# Altium project ESP32_HMI.PrjPcb
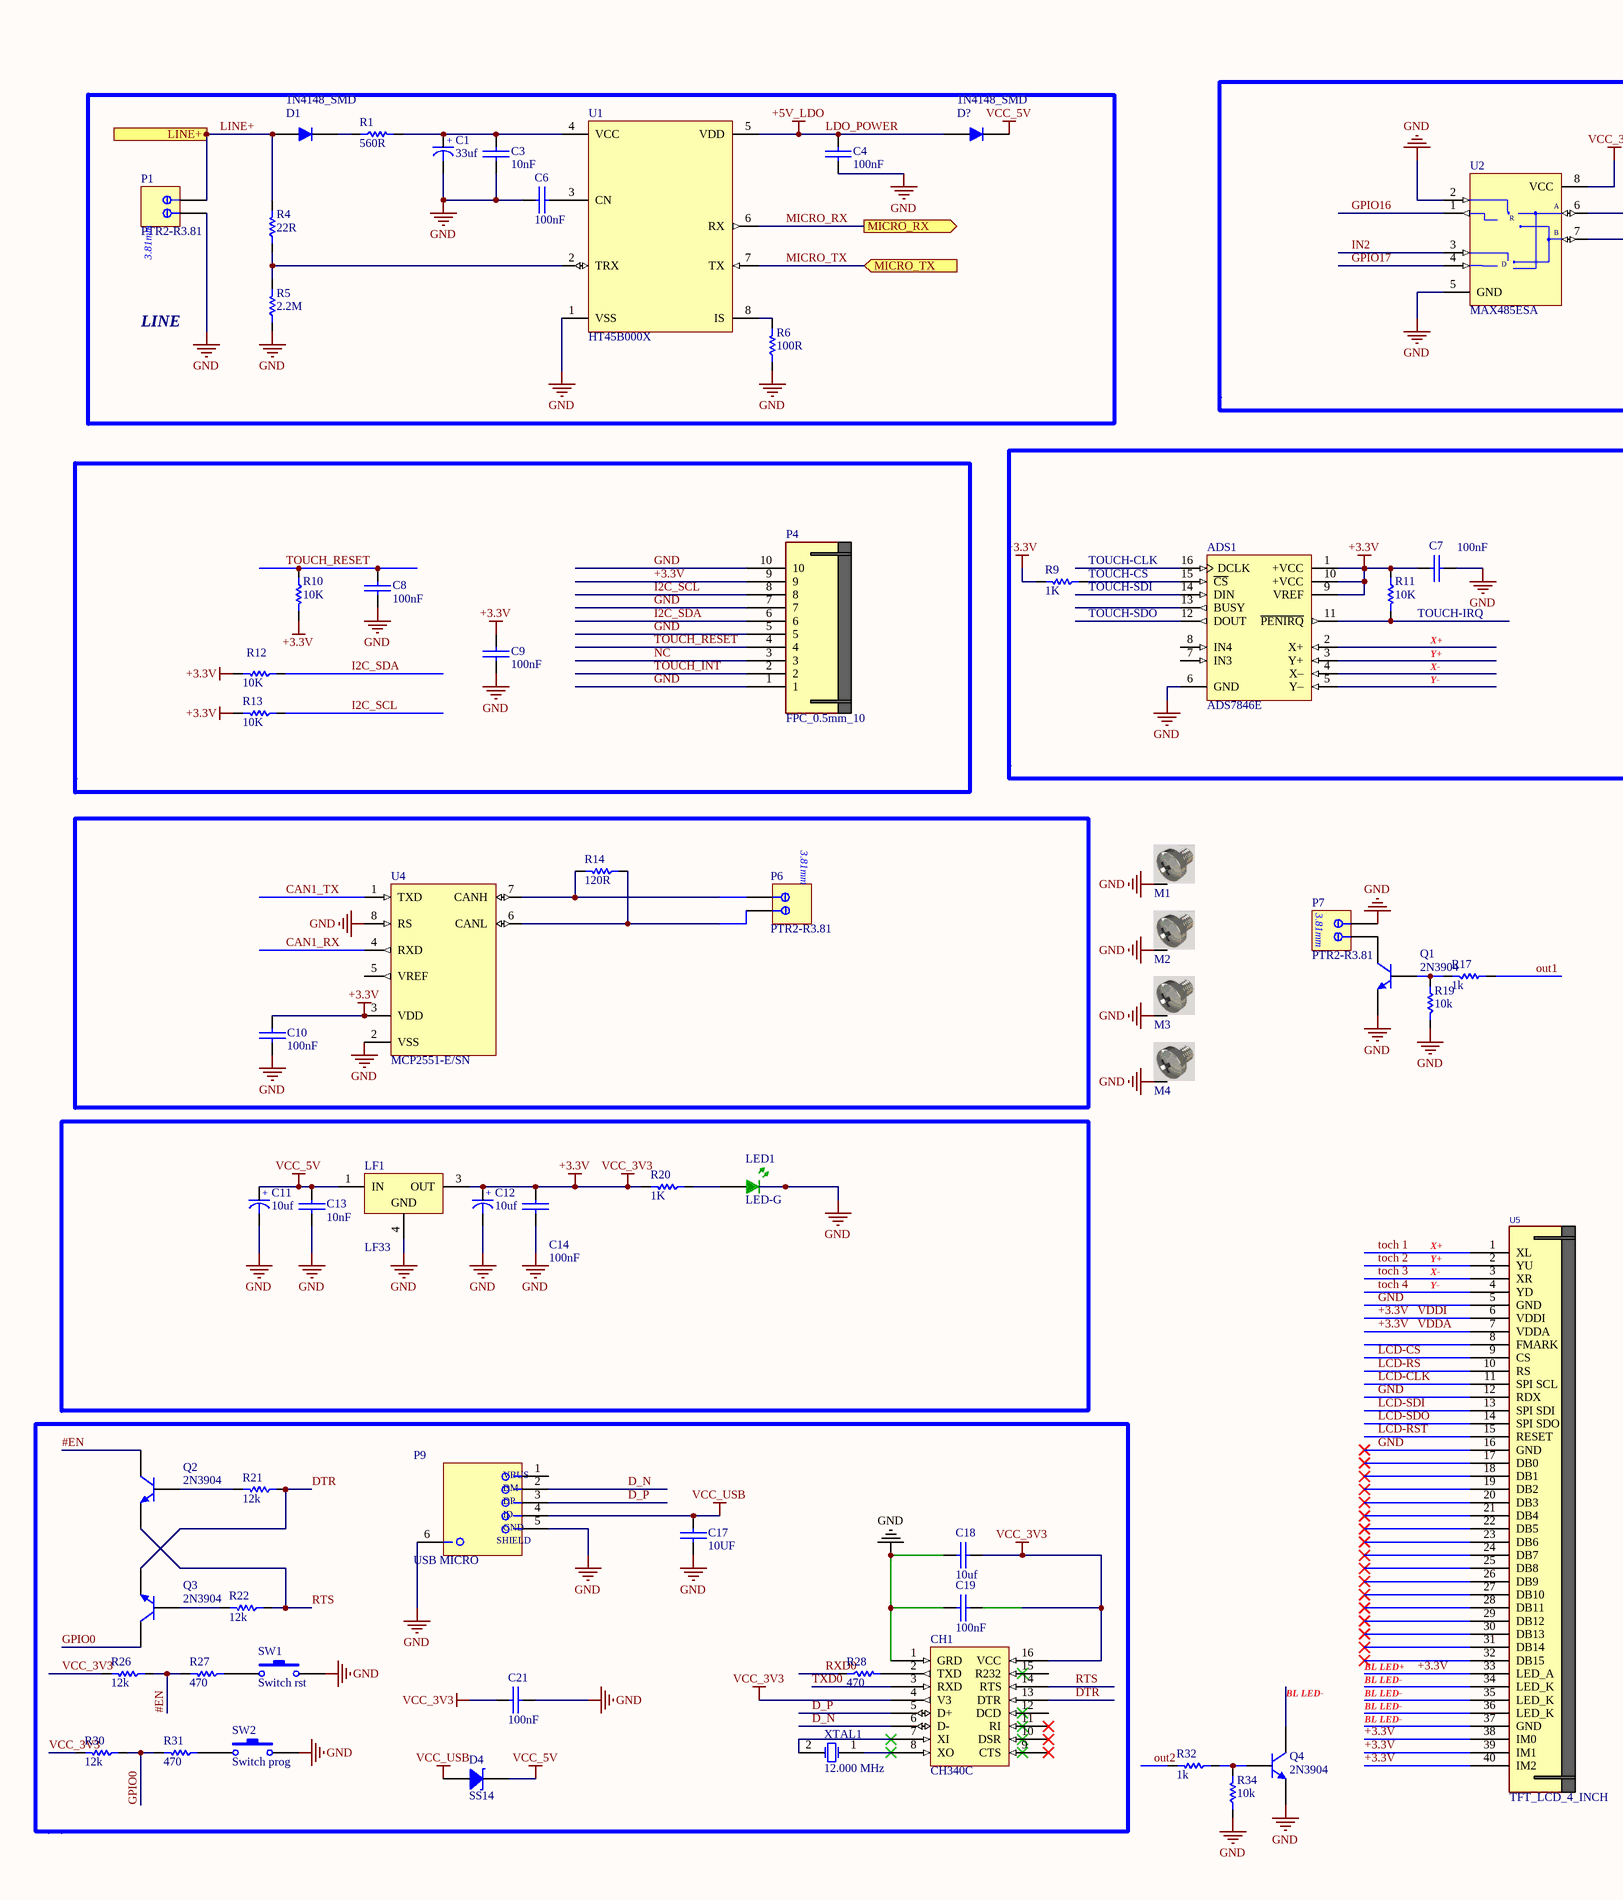
[diagram p0: ESP32_HMI.schdoc, left]
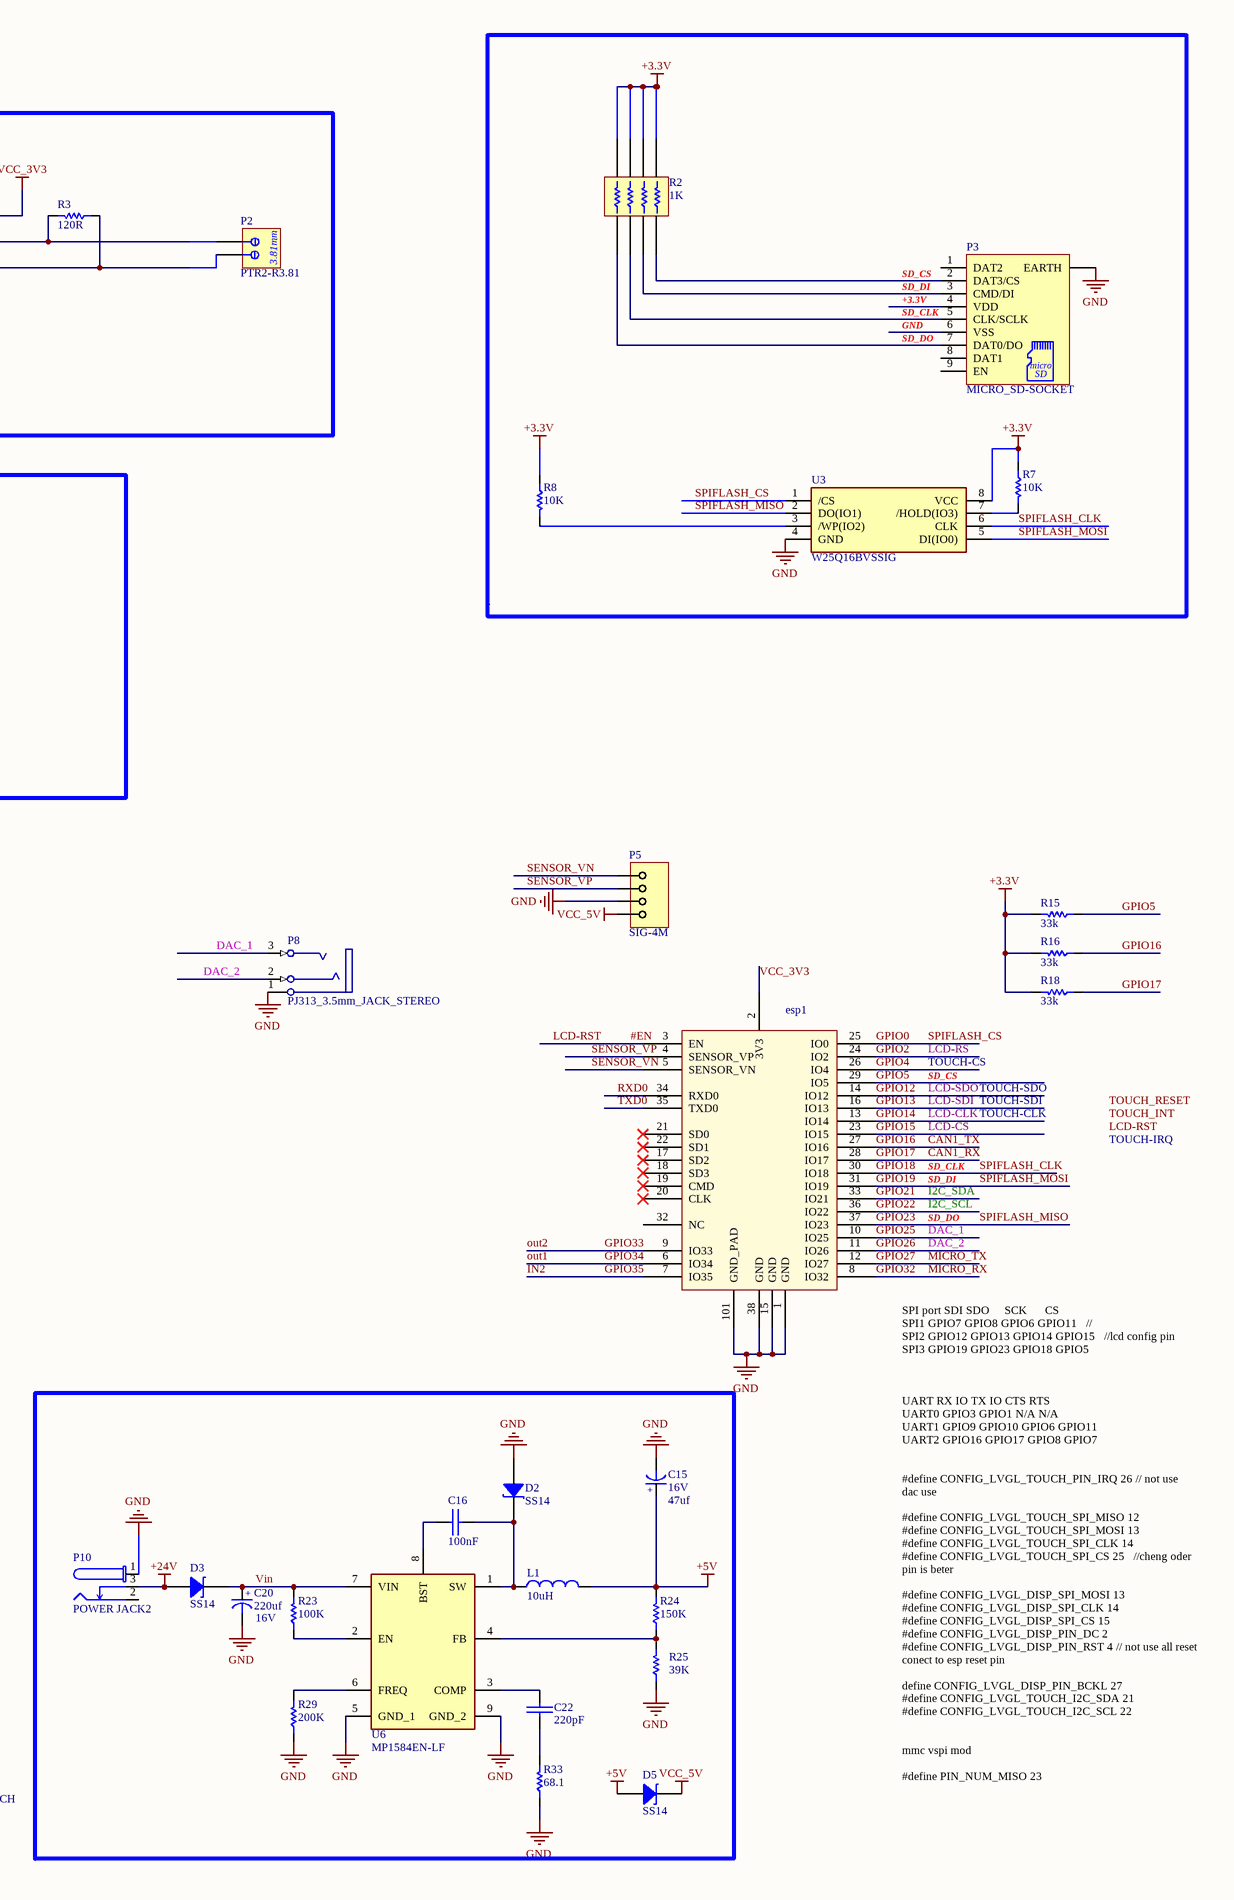
[diagram p1: ESP32_HMI.schdoc, right]
1 sheet, 93 parts. Net scope: flat (ports and power ports of the same name join across sheets).
Board file: ESP32_HMI.PcbDoc

## Sheet ESP32_HMI.schdoc
size A2

### Parts
ADS1  ADS7846E  [DBQ016]
C1  33uf  [CAP ELEC_TYPE-C]
C3  10nF  [CAP 0805]
C4  100nF  [CAP 0805]
C6  100nF  [CAP 0805]
C7  100nF  [SMD_CAP_0805]
C8  100nF  [CAP 0805]
C9  100nF  [CAP 0805]
C10  100nF  [CAP 0805]
C11  10uf  [CAP TAN_TYPE-A]
C12  10uf  [CAP TAN_TYPE-A]
C13  10nF  [CAP 0805]
C14  100nF  [CAP 0805]
C15  Voltage: 16V  [CAP ELEC_TYPE-D&D8]  (hidden comment: 47uf)
C16  100nF  [CAP 0805]
C17  10UF  [SMD_CAP_0805]
C18  10uf  [SMD_CAP_0805]
C19  100nF  [SMD_CAP_0805]
C20  Voltage: 16V  [CAP ELEC_TYPE-D&D8]  (hidden comment: 220uf)
C21  100nF  [SMD_CAP_0805]
C22  220pF  [CAP 0805]
CH1  CH340C  [751B-03_N]
D1  1N4148_SMD  [SOD-80]
D2  SS14  [SMA]
D3  SS14  [SMA]
D4  SS14  [SMA]
D5  SS14  [SMA]
D?  1N4148_SMD  [SOD-80]
esp1  ESP32S_Module  [ESP32S]  (value not drawn)
L1  10uH  [IND 23]
LED1  LED-G  [LED_G_0805]
LF1  LF33  [TO-252]
M1  Screw  [Board Screw_No Silk]  (value not drawn)
M2  Screw  [Board Screw_No Silk]  (value not drawn)
M3  Screw  [Board Screw_No Silk]  (value not drawn)
M4  Screw  [Board Screw_No Silk]  (value not drawn)
P1  PTR2-R3.81  [PTR2R-3.81]
P2  PTR2-R3.81  [PTR2R-3.81]
P3  MICRO_SD-SOCKET  [MICRO_SD]
P4  FPC_0.5mm_10  [FPC50_10]
P5  SIG-4M  [SIG4M]
P6  PTR2-R3.81  [PTR2R-3.81]
P7  PTR2-R3.81  [PTR2R-3.81]
P8  PJ313_3.5mm_JACK_STEREO  [PJ-313]
P9  USB MICRO  [MICRO_USB]
P10  POWER JACK2  [POWER10]
Q1  2N3904  [SOT23]
Q2  2N3904  [SOT23]
Q3  2N3904  [SOT23]
Q4  2N3904  [SOT23]
R1  560R  [RES 0805]
R2  1K  [RES ARRAY 1206]
R3  120R  [RES 0805]
R4  22R  [RES 0805]
R5  2.2M  [RES 0805]
R6  100R  [RES 0805]
R7  10K  [RES 0805]
R8  10K  [RES 0805]
R9  1K  [RES 0805 (2012X06L)]
R10  10K  [RES 0805]
R11  10K  [RES 0805 (2012X06L)]
R12  10K  [RES 0805]
R13  10K  [RES 0805]
R14  120R  [RES 0805]
R15  33k  [RES 0805]
R16  33k  [RES 0805]
R17  1k  [RES 0805]
R18  33k  [RES 0805]
R19  10k  [RES 0805]
R20  1K  [RES 0805]
R21  12k  [RES 0805]
R22  12k  [RES 0805]
R23  100K  [RES 0805]
R24  150K  [RES 0805]
R25  39K  [RES 0805]
R26  12k  [RES 0805]
R27  470  [RES 0805]
R28  470  [RES 0805]
R29  200K  [RES 0805]
R30  12k  [RES 0805]
R31  470  [RES 0805]
R32  1k  [RES 0805]
R33  68.1  [RES 0805]
R34  10k  [RES 0805]
SW1  Switch rst  [SW-PB]
SW2  Switch prog  [SW-PB]
U1  HT45B000X  [SO8_NARROW_N]
U2  MAX485ESA  [SO8_NARROW_L - duplicate]
U3  W25Q16BVSSIG  [SOIC-8N]
U4  MCP2551-E/SN  [SO8_NARROW_L - duplicate]
U5  TFT_LCD_4_INCH  [TFT_LCD_40PIN_BUTTOM]
U6  MP1584EN-LF  [SOIC8E]
XTAL1  12.000 MHz  [XTAL Small]

### Blocks framed on the sheet
LINE: C1 C3 C4 C6 D1 D? P1 R1 R4-R6 U1

### Ports
LINE+, MICRO_RX (out), MICRO_TX (in)

### Nets
+3.3V: ADS1.1(+VCC) ADS1.9(VREF) ADS1.10(+VCC) C7.1(+) C9.2(-) C10.1(+) C12.1(+) C14.1(+) C18.2(-) C19.2(-) C21.1(+) CH1.4(V3) CH1.16(VCC) esp1.2(3V3) LF1.3(OUT) P3.4(VDD) P4.9 R2.5 R2.6 R2.7 R2.8 R7.1 R8.1 R9.2 R10.2 R11.1 R12.2 R13.2 R15.2 R16.2 R18.2 R20.2 R26.2 R30.2 U2.8(VCC) U3.8(VCC) U4.3(VDD) U5.6(VDDI) U5.7(VDDA) U5.33(LED_A) U5.38(IM0) U5.39(IM1) U5.40(IM2)  [also labelled BL LED+, VCC_3V3, VDDA, VDDI]
+5V: C15.1(+) D5.1(A) L1.2 R24.2
+24V: D3.1(A) P10.3
GND: ADS1.6(GND) C1.2(-) C3.2(-) C4.2(-) C6.1(+) C7.2(-) C8.1(+) C9.1(+) C10.2(-) C11.2(-) C12.2(-) C13.2(-) C14.2(-) C15.2(-) C17.2(-) C18.1(+) C19.1(+) C20.2(-) C21.2(-) CH1.1(GRD) D2.1(A) esp1.1(GND) esp1.15(GND) esp1.38(GND) esp1.101(GND_PAD) LED1.2(K) LF1.4(GND) M1.S M2.S M3.S M4.S P1.2 P3.0(EARTH) P3.6(VSS) P4.1 P4.5 P4.7 P4.10 P5.3 P7.2 P8.1(GND) P9.5(GND) P9.6(GND) P10.1 Q1.2(E) Q4.2(E) R5.1 R6.1 R19.1 R25.1 R29.1 R33.1 R34.1 SW1.1 SW2.1 U1.1(VSS) U2.2(~{RE}) U2.5(GND) U3.4(GND) U4.2(VSS) U4.8(RS) U5.5(GND) U5.12(RDX) U5.16(GND) U6.5(GND_1) U6.9(GND_2)
LDO_POWER: C4.1(+) D?.1(A) U1.5(VDD)  [also labelled +5V_LDO]
VCC_5V: C11.1(+) C13.1(+) D4.2(K) D5.2(K) D?.2(K) LF1.1(IN) P5.4
VCC_USB: C17.1(+) D4.1(A) P9.4(ID)
#EN: esp1.3(EN) Q2.3(C) R26.1 R27.2 U5.15(RESET)  [also labelled LCD-RST]
BL LED-: Q4.3(C) U5.34(LED_K) U5.35(LED_K) U5.36(LED_K) U5.37(GND)
CAN1_RX: esp1.28(IO17) R18.1 U2.4(DI) U4.4(RXD)  [also labelled GPIO17]
CAN1_TX: esp1.27(IO16) R16.1 U2.1(RO) U4.1(TXD)  [also labelled GPIO16]
D_N: CH1.6(D-) P9.2(DM)
D_P: CH1.5(D+) P9.3(DP)
DAC_1: esp1.10(IO25) P8.3(L)  [also labelled GPIO25]
DAC_2: esp1.11(IO26) P8.2(R)  [also labelled GPIO26]
DTR: CH1.13(DTR) Q3.2(E) R21.1
GPIO0: esp1.25(IO0) Q3.3(C) R30.1 R31.2 U3.1(/CS)  [also labelled SPIFLASH_CS]
GPIO2: esp1.24(IO2) U5.10(RS)  [also labelled LCD-RS]
GPIO4: ADS1.15(~{CS}) esp1.26(IO4) R9.1  [also labelled TOUCH-CS]
GPIO5: esp1.29(IO5) P3.2(DAT3/CS) R2.4 R15.1  [also labelled SD_CS]
GPIO12: ADS1.12(DOUT) esp1.14(IO12) U5.14(SPI_SDO)  [also labelled LCD-SDO, TOUCH-SDO]
GPIO13: ADS1.14(DIN) esp1.16(IO13) U5.13(SPI_SDI)  [also labelled LCD-SDI, TOUCH-SDI]
GPIO14: ADS1.16(DCLK) esp1.13(IO14) U5.11(SPI_SCL)  [also labelled LCD-CLK, TOUCH-CLK]
GPIO15: esp1.23(IO15) U5.9(CS)  [also labelled LCD-CS]
GPIO18: esp1.30(IO18) P3.5(CLK/SCLK) R2.2 U3.6(CLK)  [also labelled SD_CLK, SPIFLASH_CLK]
GPIO19: esp1.31(IO19) P3.3(CMD/DI) R2.3 U3.5(DI(IO0))  [also labelled SD_DI, SPIFLASH_MOSI]
GPIO21: esp1.33(IO21) P4.6 R12.1  [also labelled I2C_SDA]
GPIO22: esp1.36(IO22) P4.8 R13.1  [also labelled I2C_SCL]
GPIO23: esp1.37(IO23) P3.7(DAT0/DO) R2.1 U3.2(DO(IO1))  [also labelled SD_DO, SPIFLASH_MISO]
GPIO27: esp1.12(IO27) U1.7(TX) ; port MICRO_TX  [also labelled MICRO_TX]
GPIO32: esp1.8(IO32) U1.6(RX) ; port MICRO_RX  [also labelled MICRO_RX]
GPIO33: esp1.9(IO33) R32.2  [also labelled out2]
GPIO34: esp1.6(IO34) R17.2  [also labelled out1]
GPIO35: esp1.7(IO35) U2.3(DE)  [also labelled IN2]
LINE+: D1.1(A) P1.1 R4.2 ; port LINE+
NC: P4.3
RTS: CH1.14(RTS) Q2.2(E) R22.1
RXD0: esp1.34(RXD0) R28.1
SENSOR_VN: esp1.5(SENSOR_VN) P5.1
SENSOR_VP: esp1.4(SENSOR_VP) P5.2
toch 1: ADS1.2(X+) U5.1(XL)  [also labelled X+]
toch 2: ADS1.3(Y+) U5.2(YU)  [also labelled Y+]
toch 3: ADS1.4(X–) U5.3(XR)  [also labelled X-]
toch 4: ADS1.5(Y–) U5.4(YD)  [also labelled Y-]
TOUCH-IRQ: ADS1.11(~{PENIRQ}) R11.2
TOUCH_INT: P4.2
TOUCH_RESET: C8.2(-) P4.4 R10.1
TXD0: CH1.3(RXD) esp1.35(TXD0)
Vin: C20.1(+) D3.2(K) R23.2 U6.7(VIN)
NetC1_1: C1.1(+) C3.1(+) R1.2 U1.4(VCC)
NetC6_2: C6.2(-) U1.3(CN)
NetC16_1: C16.1(+) U6.8(BST)
NetC16_2: C16.2(-) D2.2(K) L1.1 U6.1(SW)
NetC22_1: C22.1(+) U6.3(COMP)
NetC22_2: C22.2(-) R33.2
NetCH1_2: CH1.2(TXD) R28.2
NetCH1_7: CH1.7(XI) XTAL1.2(OSC2)
NetCH1_8: CH1.8(XO) XTAL1.1(OSC1)
NetD1_2: D1.2(K) R1.1
NetLED1_1: LED1.1(A) R20.1
NetP2_1: P2.1 R3.2 U2.6(A)
NetP2_2: P2.2 R3.1 U2.7(B)
NetP6_1: P6.1 R14.1 U4.6(CANL)
NetP6_2: P6.2 R14.2 U4.7(CANH)
NetP7_1: P7.1 Q1.3(C)
NetQ1_1: Q1.1(B) R17.1 R19.2
NetQ2_1: Q2.1(B) R21.2
NetQ3_1: Q3.1(B) R22.2
NetQ4_1: Q4.1(B) R32.1 R34.2
NetR4_1: R4.1 R5.2 U1.2(TRX)
NetR6_2: R6.2 U1.8(IS)
NetR7_2: R7.2 U3.7(/HOLD(IO3))
NetR8_2: R8.2 U3.3(/WP(IO2))
NetR23_1: R23.1 U6.2(EN)
NetR24_1: R24.1 R25.2 U6.4(FB)
NetR27_1: R27.1 SW1.2
NetR29_2: R29.2 U6.6(FREQ)
NetR31_1: R31.1 SW2.2

Not connected (* = marked no-connect by the designer): ADS1 7(IN3) 8(IN4) 13(BUSY); CH1 9(CTS)* 10(DSR)* 11(RI)* 12(DCD) 15(R232); esp1 17(SD2)* 18(SD3)* 19(CMD)* 20(CLK)* 21(SD0)* 22(SD1)* 32(NC); P3 1(DAT2) 8(DAT1) 9(EN); P9 1(VBUS); P10 2; U4 5(VREF); U5 8(FMARK) 17(DB0)* 18(DB1)* 19(DB2)* 20(DB3)* 21(DB4)* 22(DB5)* 23(DB6)* 24(DB7)* 25(DB8)* 26(DB9)* 27(DB10)* 28(DB11)* 29(DB12)* 30(DB13)* 31(DB14)* 32(DB15)*

### Notes on the sheet
- SPI port SDI	SDO	    SCK	     CS
  SPI1	GPIO7	GPIO8	GPIO6	GPIO11   //
  SPI2	GPIO12	GPIO13	GPIO14	GPIO15   //lcd config pin
  SPI3	GPIO19	GPIO23	GPIO18	GPIO5
  UART	RX IO	TX IO	CTS	RTS
  UART0	GPIO3	GPIO1	N/A	N/A
  UART1	GPIO9	GPIO10	GPIO6	GPIO11
  UART2	GPIO16	GPIO17	GPIO8	GPIO7
  #define CONFIG_LVGL_TOUCH_PIN_IRQ 26 // not use  dac use
  #define CONFIG_LVGL_TOUCH_SPI_MISO 12
  #define CONFIG_LVGL_TOUCH_SPI_MOSI 13
  #define CONFIG_LVGL_TOUCH_SPI_CLK 14
  #define CONFIG_LVGL_TOUCH_SPI_CS 25   //cheng oder pin is beter
  #define CONFIG_LVGL_DISP_SPI_MOSI 13
  #define CONFIG_LVGL_DISP_SPI_CLK 14
  #define CONFIG_LVGL_DISP_SPI_CS 15
  #define CONFIG_LVGL_DISP_PIN_DC 2
  #define CONFIG_LVGL_DISP_PIN_RST 4 // not use all reset conect to esp reset pin
  define CONFIG_LVGL_DISP_PIN_BCKL 27
  #define CONFIG_LVGL_TOUCH_I2C_SDA 21
  #define CONFIG_LVGL_TOUCH_I2C_SCL 22
  mmc vspi mod
  #define PIN_NUM_MISO 23
  #define PIN_NUM_MOSI 19
  #define PIN_NUM_CLK  18
  #define PIN_NUM_CS   5
- Labels drawn without touching a wire or pin: LCD-RST, TOUCH-IRQ, TOUCH_INT, TOUCH_RESET
- (in symbol MAX485ESA) R; D
- (in symbol MICRO_SD) micro; SD
- (in symbol USB MICRO) SHIELD

### Library data of the parts
ADS1 = ADS7846E: 4-Wire Touch Screen Controller, 16-Pin SSOP; Published: 6-Oct-2005; DatasheetVersion: Jan-2005; PackageVersion: Feb-2005; PackageReference: DBQ016; Publisher: Altium Limited; PackageDescription: SSOP; 16 Leads; Body Width 3.9 mm; Pitch 0.635 mm; Code_JEDEC: MO-137-AB; ComponentLink1Description: Manufacturer Link; ComponentLink1URL: http://focus.ti.com/docs/prod/folders/print/ads7846.html; ComponentLink2Description: Datasheet; ComponentLink2URL: http://focus.ti.com/lit/ds/symlink/ads7846.pdf
C1 C11 C12 = CAPACITOR POLAR: Polar Capacitor; Voltage: 100V; Designer: Amin lezgi; Adding Date: 1398/04/17
  C1: Value: 33uf
  C11 C12: Value: 10uf
C3 C4 C6 C8-C10 C13 C14 C16 C22 = CAPACITOR BIPOLAR: Bipolar Capacitor; Designer: Amin Lezgi; Adding Date: 1398/5/7
  C3 C13: Value: 10nF
  C4 C6 C8-C10 C14 C16: Value: 100nF
  C22: Value: 220pF
C7 C17-C19 C21 = Cap-Bipolar: Bipolar Capacitor; Voltage: 100V; Designer: Saeid Jorablo; Organazation: ControTec; Adding Date: 1387/12/20
  C7 C19 C21: Value: 100nF
  C17: Value: 10UF
  C18: Value: 10uf
C15 C20 = CAPACITOR POLAR: Polar Capacitor; Designer: Amin lezgi; Adding Date: 1398/04/17
  C15: Value: 47uf
  C20: Value: 220uf
CH1 = CH340G
D2-D5 = SS14_SMD: SCHOTTKY DIODE_SMA; Published: 8-Jun-2000; LatestRevisionDate: 08-Jul-2005; LatestRevisionNote: Mech Layer 1 removed.; PackageReference: LED-0; Publisher: Altium Limited
esp1 = ESP32S_Module: Esp-32S; Datasheet: https://espressif.com/sites/default/files/documentation/esp_wroom_32_datasheet_en.pdf
L1 = INDUCTOR: Value: 10uH
LED1 = LED_SMD_GREEN: LED_SMD; Published: 8-Jun-2000; LatestRevisionDate: 08-Jul-2005; LatestRevisionNote: Mech Layer 1 removed.; PackageReference: LED-0; Publisher: Altium Limited
LF1 = L78M05: Precision 500mA Regulator
M1-M4 = Board Screw: Board Screw With Spacer
P1 P2 P6 P7 = PTR_RIGHT-2pin: 3.81mm
P3 = MICRO_SD
P4 = FPC50_10: CONN, FPC, 0.50mm pitch, RightAngle, Bot. Contact, Hinge type; DESC: LCD Touch; MANF: Wurth Elektronik; MANF_P#: 687110149022; VALUE: FPC_0.5mm_10
P5 = SIG-4M: MALE
P8 = HEAD_PHONE_PJ313: 3.3mm audio jack stereo; Designer: amin lezgi; PART NUMBER: ?; Value: ?
P10 = POWER JACK: Designer: aminlezgi
Q1-Q4 = NPN BJT: COMPANY: ADD COMPANY; DESIGNER: AMIN LEZGI; VALUE: 2N3904
R1 R4-R8 R10 R12 R13 R15-R23 R26-R34 = RESISTOR: Tolerance: 5%; Power: 1/8 W
  R1: Value: 560R
  R4: Value: 22R
  R5: Value: 2.2M
  R6: Value: 100R
  R7 R8 R10 R12 R13: Value: 10K
  R15 R16 R18: Value: 33k
  R17 R32: Value: 1k
  R19 R34: Value: 10k
  R20: Value: 1K
  R21 R22 R26 R30: Value: 12k
  R23: Value: 100K
  R27 R28 R31: Value: 470
  R29: Value: 200K
  R33: Value: 68.1
R2 = RESISTOR ARRAY: Value: 1K
R3 R14 = RESISTOR: Tolerance: 1; Power: 1/8 W; Value: 120R
R9 R11 = Resistor: Tolerance: 5%; Power: 1/8 W
  R9: Value: 1K
  R11: Value: 10K
R24 R25 = RESISTOR: Tolerance: 1%; Power: 1/8 W
  R24: Value: 150K
  R25: Value: 39K
SW1 SW2 = Switch PB: Push Button Switch
U1 = HT45B000X: Complete Data Transmission on Power Line / functions; Designer: Amin Lezgi
U2 = MAX485ESA: Low-Power, Slew-Rate-Limited RS-485/RS-422 Transceiver; Published: 16-Jan-2001; LatestRevisionDate: 13-Apr-2006; LatestRevisionNote: IPC-7351 Footprint Added.; DatasheetVersion: Feb-1996; PackageReference: NSO8; Publisher: Altium Limited; PackageDescription: 8-Pin Small Outline Integrated Circuit 1.27 mm Pitch; Code_JEDEC: MS-012-AA; Code_IPC: SOIC127P600-8; ComponentLink1Description: Manufacturer Link; ComponentLink1URL: http://www.maxim-ic.com/; ComponentLink2Description: Datasheet; ComponentLink2URL: http://pdfserv.maxim-ic.com/en/ds/MAX1487-MAX491.pdf
U3 = W25Q16BVSSIG_TR: Integrated Circuit; Manufacturer_Name: Winbond; Manufacturer_Part_Number: W25Q16BVSSIG TR; designer: amin lezgi; Datasheet Link: https://media.digikey.com/pdf/Data%20Sheets/Winbond%20PDFs/W25Q16BV.pdf; Height: 2.16mm; Mouser Part Number: N/A; Mouser Price/Stock: https://www.mouser.com/Search/Refine.aspx?Keyword=N%2FA
U4 = MCP2551-E/SN: High-Speed CAN Transceiver, 8-Pin SOIC, Extended Temperature; Published: 29-Jan-2009; DatasheetVersion: revE, Jan-2007; PackageVersion: revBB, Aug-2009; PackageReference: SOIC-SN8; Publisher: Altium Limited; PackageDescription: 8-Lead Plastic Small Outline (SN) - Narrow, 3.90mm Body [SOIC]; Supplier 1: Digi-Key; Supplier Part Number 1: MCP2551-E/SN-ND; Supplier 2: Farnell; Supplier Part Number 2: 1467746; Supplier 3: Farnell; Supplier Part Number 3: 4687887; Code_JEDEC: MS-012; Code_IPC: SOIC127P600-8; ComponentLink1Description: Datasheet; ComponentLink1URL: http://ww1.microchip.com/downloads/en/DeviceDoc/21667E.pdf; ComponentLink2Description: Packaging Specification; ComponentLink2URL: http://www.microchip.com/stellent/groups/techpub_sg/documents/packagingspec/en012702.pdf; ComponentLink3Description: Microchip.com Home; ComponentLink3URL: http://www.microchip.com/
U5 = TFT_LCD_4_INCH: TFT LCD 4 inch - 320x480 With Touch - 3Line-SPI/4 Line-SPI/8bit/16bit interface ST7796S; MANF: Hirose; MANF_P#: FH12A-40S-0.5SH; VALUE: TFT_LCD_4_INCH
U6 = MP1584EN-LF: Integrated Circuit; Manufacturer_Name: Monolithic Power Systems (MPS); designer: amin lezgi; Datasheet Link: https://componentsearchengine.com/Datasheets/1/MP1584EN-LF.pdf; Height: 1.7mm; Manufacturer_Part_Number: MP1584EN-LF; Arrow Part Number: MP1584EN-LF; Mouser Part Number: 946-MP1584ENLF; Mouser Price/Stock: https://www.mouser.com/Search/Refine.aspx?Keyword=946-MP1584ENLF
XTAL1 = XTAL: XTAL Crystal; Company: E.P.I.L; Design Date: 11/04/2011; Value: 12.000 MHz
D1 D? = 1N4148_SMD: Published: 8-Jun-2000; LatestRevisionDate: 08-Jul-2005; LatestRevisionNote: Mech Layer 1 removed.; PackageReference: LED-0; Publisher: Altium Limited